# Altium schematic sheet 01.STC16F40K128_MCU.SchDoc: 01.STC16F40K128_MCU
size A4; Organization: Altium Limited; Address1: L3, 12a Rodborough Rd; Address2: Frenchs Forest; Address3: NSW; Address4: Australia 2086; Revision: V1; SheetNumber: 2; SheetTotal: 6; Project: STC16F40K128
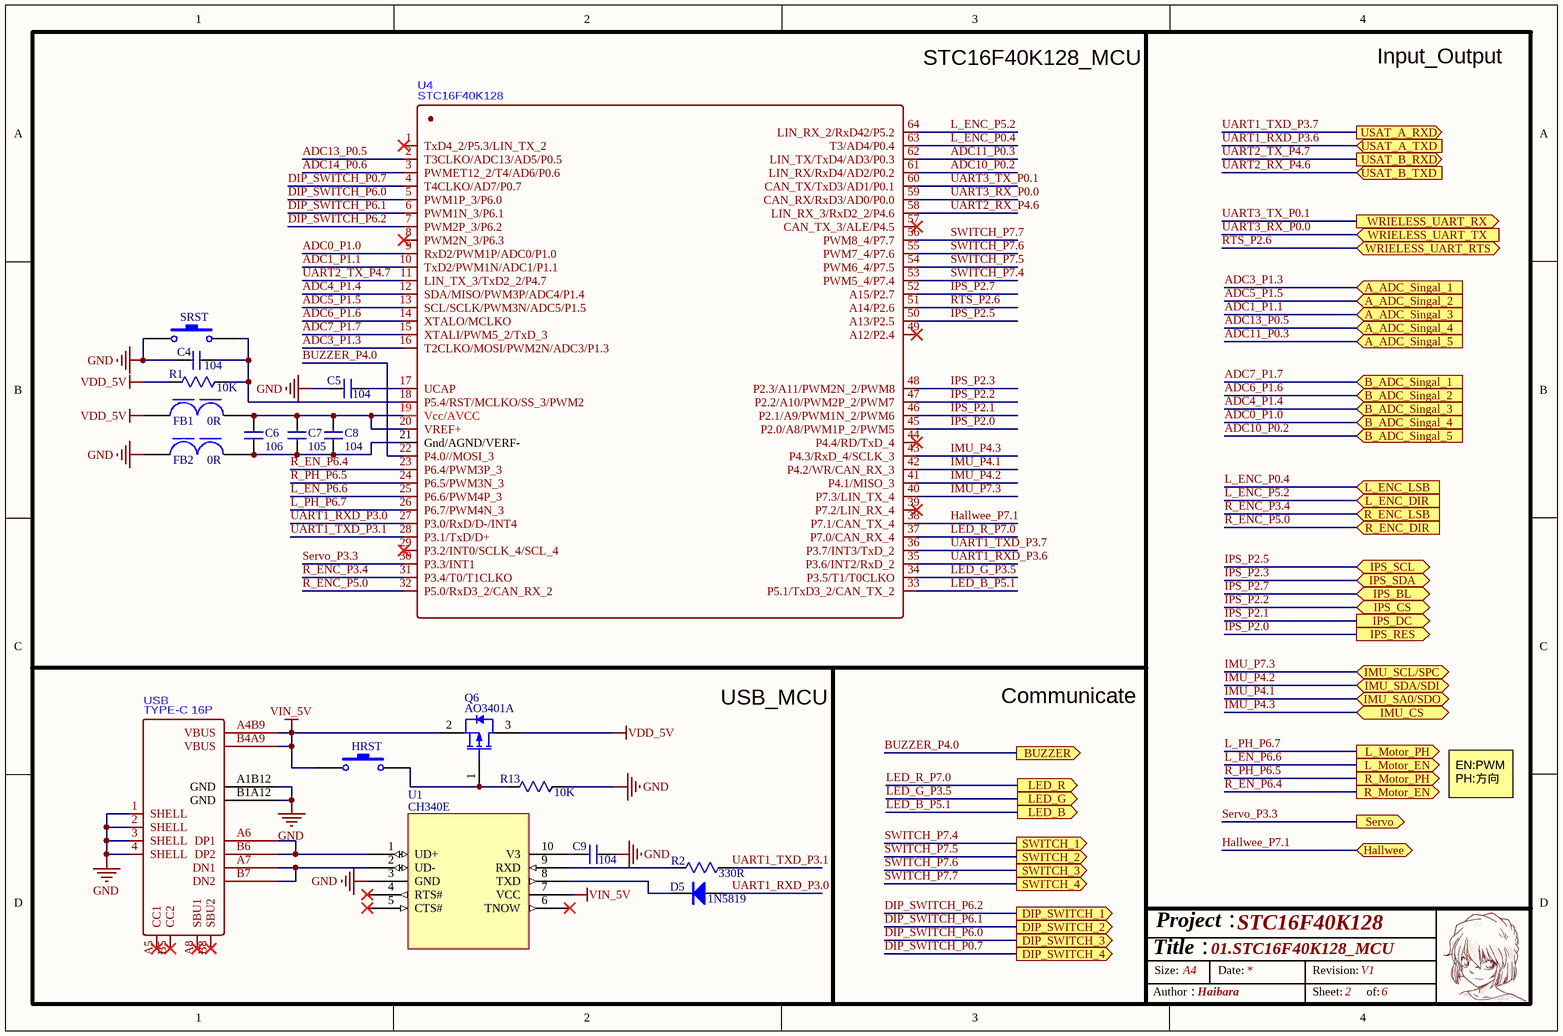
[diagram p0: 01.STC16F40K128_MCU.SchDoc]

## Parts
C4  104  [C0603]
C5  104  [C0603]
C6  106  [C0603]
C7  105  [C0603]
C8  104  [C0603]
C9  104  [C0603]
D5  1N5819  [SOD-523]
FB1  0R  [0805 磁珠 FB3]
FB2  0R  [0805 磁珠 FB3]
HRST  SW-PB  [TSW SMD-3*6*2.5]  (value not drawn)
Q6  AO3401A  [AO-SOT-23-3L_V]
R1  10K  [R0603]
R2  330R  [R0603]
R13  10K  [R0603]
SRST  SW-PB  [TSW SMD-3*6*2.5]  (value not drawn)
U1  CH340E  [MSOP10]
U4  STC16F40K128  [LQFP-64_L10.0-W10.0-P0.50-LS12.0-BL]
USB  TYPE-C 16P  [USB-C-SMD_TYPE-C16PIN_C668624]

## Ports
A_ADC_Singal_1 (in), A_ADC_Singal_2 (in), A_ADC_Singal_3 (in), A_ADC_Singal_4 (in), A_ADC_Singal_5 (in), B_ADC_Singal_1 (in), B_ADC_Singal_2 (in), B_ADC_Singal_3 (in), B_ADC_Singal_4 (in), B_ADC_Singal_5 (in), BUZZER (out), DIP_SWITCH_1 (out), DIP_SWITCH_2 (out), DIP_SWITCH_3 (out), DIP_SWITCH_4 (out), Hallwee (bidir), IMU_CS (bidir), IMU_SA0/SDO (bidir), IMU_SCL/SPC (bidir), IMU_SDA/SDI (bidir), IPS_BL (bidir), IPS_CS (bidir), IPS_DC (out), IPS_RES (out), IPS_SCL (bidir), IPS_SDA (bidir), L_ENC_DIR (in), L_ENC_LSB (in), L_Motor_EN (out), L_Motor_PH (out), LED_B (out), LED_G (out), LED_R (out), R_ENC_DIR (in), R_ENC_LSB (in), R_Motor_EN (out), R_Motor_PH (out), Servo (out), SWITCH_1 (out), SWITCH_2 (out), SWITCH_3 (out), SWITCH_4 (out), USAT_A_RXD (out), USAT_A_TXD (in), USAT_B_RXD (out), USAT_B_TXD (in), WRIELESS_UART_RTS (bidir), WRIELESS_UART_RX (out), WRIELESS_UART_TX (in)

## Nets
GND: C4.1 C5.2 C9.1 FB2.1 R13.2 SRST.1 U1.3(GND) USB.1(SHELL) USB.2(SHELL) USB.3(SHELL) USB.4(SHELL) USB.A1B12(GND) USB.B1A12(GND)
VDD_5V: FB1.1 Q6.3(DRAIN) R1.1
VIN_5V: HRST.1 Q6.2(SOURCE) U1.7(VCC) USB.A4B9(VBUS) USB.B4A9(VBUS)
ADC0_P1.0: U4.9(RxD2/PWM1P/ADC0/P1.0) ; port B_ADC_Singal_4
ADC1_P1.1: U4.10(TxD2/PWM1N/ADC1/P1.1) ; port A_ADC_Singal_3
ADC3_P1.3: U4.16(T2CLKO/MOSI/PWM2N/ADC3/P1.3) ; port A_ADC_Singal_1
ADC4_P1.4: U4.12(SDA/MISO/PWM3P/ADC4/P1.4) ; port B_ADC_Singal_3
ADC5_P1.5: U4.13(SCL/SCLK/PWM3N/ADC5/P1.5) ; port A_ADC_Singal_2
ADC6_P1.6: U4.14(XTALO/MCLKO) ; port B_ADC_Singal_2
ADC7_P1.7: U4.15(XTALI/PWM5_2/TxD_3) ; port B_ADC_Singal_1
ADC10_P0.2: U4.61(LIN_RX/RxD4/AD2/P0.2) ; port B_ADC_Singal_5
ADC11_P0.3: U4.62(LIN_TX/TxD4/AD3/P0.3) ; port A_ADC_Singal_5
ADC13_P0.5: U4.2(T3CLKO/ADC13/AD5/P0.5) ; port A_ADC_Singal_4
ADC14_P0.6: U4.3(PWMET12_2/T4/AD6/P0.6)
BUZZER_P4.0: U4.22(P4.0//MOSI_3) ; port BUZZER
DIP_SWITCH_P0.7: U4.4(T4CLKO/AD7/P0.7) ; port DIP_SWITCH_4
DIP_SWITCH_P6.0: U4.5(PWM1P_3/P6.0) ; port DIP_SWITCH_3
DIP_SWITCH_P6.1: U4.6(PWM1N_3/P6.1) ; port DIP_SWITCH_2
DIP_SWITCH_P6.2: U4.7(PWM2P_3/P6.2) ; port DIP_SWITCH_1
Hallwee_P7.1: U4.38(P7.1/CAN_TX_4) ; port Hallwee
IMU_P4.1: U4.42(P4.2/WR/CAN_RX_3) ; port IMU_SA0/SDO
IMU_P4.2: U4.41(P4.1/MISO_3) ; port IMU_SDA/SDI
IMU_P4.3: U4.43(P4.3/RxD_4/SCLK_3) ; port IMU_CS
IMU_P7.3: U4.40(P7.3/LIN_TX_4) ; port IMU_SCL/SPC
IPS_P2.0: U4.45(P2.0/A8/PWM1P_2/PWM5) ; port IPS_RES
IPS_P2.1: U4.46(P2.1/A9/PWM1N_2/PWM6) ; port IPS_DC
IPS_P2.2: U4.47(P2.2/A10/PWM2P_2/PWM7) ; port IPS_CS
IPS_P2.3: U4.48(P2.3/A11/PWM2N_2/PWM8) ; port IPS_SDA
IPS_P2.5: U4.50(A13/P2.5) ; port IPS_SCL
IPS_P2.7: U4.52(A15/P2.7) ; port IPS_BL
L_EN_P6.6: U4.25(P6.6/PWM4P_3) ; port L_Motor_EN
L_ENC_P0.4: U4.63(T3/AD4/P0.4) ; port L_ENC_LSB
L_ENC_P5.2: U4.64(LIN_RX_2/RxD42/P5.2) ; port L_ENC_DIR
L_PH_P6.7: U4.26(P6.7/PWM4N_3) ; port L_Motor_PH
LED_B_P5.1: U4.33(P5.1/TxD3_2/CAN_TX_2) ; port LED_B
LED_G_P3.5: U4.34(P3.5/T1/T0CLKO) ; port LED_G
LED_R_P7.0: U4.37(P7.0/CAN_RX_4) ; port LED_R
R_EN_P6.4: U4.23(P6.4/PWM3P_3) ; port R_Motor_EN
R_ENC_P3.4: U4.31(P3.4/T0/T1CLKO) ; port R_ENC_LSB
R_ENC_P5.0: U4.32(P5.0/RxD3_2/CAN_RX_2) ; port R_ENC_DIR
R_PH_P6.5: U4.24(P6.5/PWM3N_3) ; port R_Motor_PH
RTS_P2.6: U4.51(A14/P2.6) ; port WRIELESS_UART_RTS
Servo_P3.3: U4.30(P3.3/INT1) ; port Servo
SWITCH_P7.4: U4.53(PWM5_4/P7.4) ; port SWITCH_1
SWITCH_P7.5: U4.54(PWM6_4/P7.5) ; port SWITCH_2
SWITCH_P7.6: U4.55(PWM7_4/P7.6) ; port SWITCH_3
SWITCH_P7.7: U4.56(PWM8_4/P7.7) ; port SWITCH_4
UART1_RXD_P3.0: D5.1(A) U4.27(P3.0/RxD/D-/INT4)
UART1_RXD_P3.6: U4.35(P3.6/INT2/RxD_2) ; port USAT_A_TXD
UART1_TXD_P3.1: R2.1 U4.28(P3.1/TxD/D+)
UART1_TXD_P3.7: U4.36(P3.7/INT3/TxD_2) ; port USAT_A_RXD
UART2_RX_P4.6: U4.58(LIN_RX_3/RxD2_2/P4.6) ; port USAT_B_TXD
UART2_TX_P4.7: U4.11(LIN_TX_3/TxD2_2/P4.7) ; port USAT_B_RXD
UART3_RX_P0.0: U4.59(CAN_RX/RxD3/AD0/P0.0) ; port WRIELESS_UART_TX
UART3_TX_P0.1: U4.60(CAN_TX/TxD3/AD1/P0.1) ; port WRIELESS_UART_RX
NetC4_2: C4.2 R1.2 SRST.2 U4.18(P5.4/RST/MCLKO/SS_3/PWM2)
NetC5_1: C5.1 U4.17(UCAP)
NetC6_1: C6.1 C7.1 C8.1 FB2.2 U4.21(Gnd/AGND/VERF-)
NetC6_2: C6.2 C7.2 C8.2 FB1.2 U4.19(Vcc/AVCC) U4.20(VREF+)
NetC9_2: C9.2 U1.10(V3)
NetD5_2: D5.2(K) U1.8(TXD)
NetHRST_2: HRST.2 Q6.1(GATE) R13.1
NetR2_2: R2.2 U1.9(RXD)
NetU1_1: U1.1(UD+) USB.A6(DP1) USB.B6(DP2)
NetU1_2: U1.2(UD-) USB.A7(DN1) USB.B7(DN2)

Not connected (* = marked no-connect by the designer): U1 4(RTS#)* 5(CTS#)* 6(TNOW)*; U4 1(TxD4_2/P5.3/LIN_TX_2)* 8(PWM2N_3/P6.3)* 29(P3.2/INT0/SCLK_4/SCL_4)* 39(P7.2/LIN_RX_4)* 44(P4.4/RD/TxD_4)* 49(A12/P2.4)* 57(CAN_TX_3/ALE/P4.5)*; USB A5(CC1)* A8(SBU1)* B5(CC2)* B8(SBU2)*

## Notes on the sheet
- STC16F40K128_MCU
- Input_Output
- USB_MCU
- Communicate
- EN:PWM
  PH:方向
- Title：
- Size:
- Project：
- A4
- Date:
- Revision:
- Author：
- Haibara
- Sheet:
- of:

## Library data of the parts
C4-C9 = 电容
D5 = 1N5819: 肖特基二极管; 淘宝ID: 黄晶宝石; 属性: 40V/2A; BOM名称: 肖特基二极管; 欢迎光临: https://shop463601444.taobao.com
FB1 FB2 = FB
HRST SRST = SW-PB: Switch; Published: 24-Mar-1999; LatestRevisionDate: 17-Jul-2002; LatestRevisionNote: Re-released for DXP Platform.; PackageReference: SPST-2; Publisher: Altium Limited; PackageDescription: Switch; 2 Leads
Q6 = CMP-2000-05778-1: P-Channel MOSFET, 30 V, 4 A, -55 to 150 degC, 3-Pin SOT-23-3L, RoHS, Tape and Reel; Manufacturer: Alpha and Omega; Output Power (Max): NotRequiredW; Power Dissipation: 1.4W; Rad Hardened: No; Drain Efficiency: NotRequired%; Drain-Source On-Volt: 30V; Noise Figure: NotRequireddB; Frequency (Max): NotRequiredMHz; Number of  Elements: 1; Gate-Source Voltage (Max): ?12V; Drain Current (Max): 4A; Channel Mode: Enhancement; Drain-Source On-Res: 0.044ohm; Type: PowerMOSFET; Polarity: P; Package URL: http://www.aosmd.com/res/packaging_information/SOT-23-3L.pdf; Datasheet URL: http://www.aosmd.com/res/data_sheets/AO3401A.pdf; Package Type: SOT-23; Package Description: 3-Pin Small Outline Transistor, Body 2.95 x 1.6 mm, Pitch 0.95 mm; Mounting: SurfaceMount; Manufacturer URL: http://www.aosmd.com/; Continuous Drain Current: 4A; Package Reference: SOT-23-3L; Mounting Technology: SurfaceMount; Operating Temperature Classification: Military; Power Gain: NotRequireddB; Datasheet Version: Rev. 3, 03/2011; Operating Temp Range: -55Cto150C; Pin Count: 3
R1 R2 R13 = 电阻
U1 = CH340E: USB to TTL Serial / UART